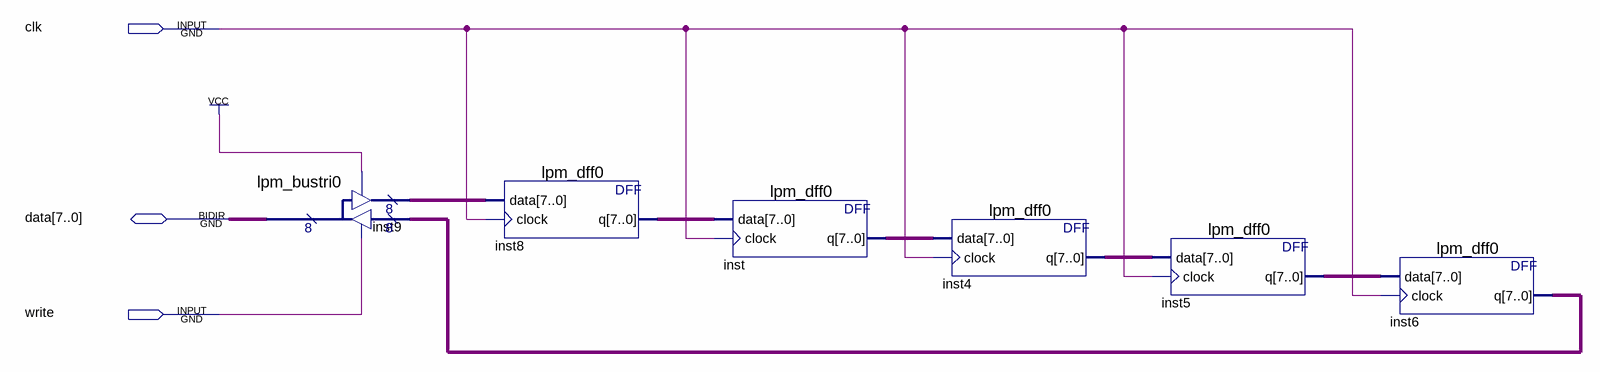
[diagram p0: schematic sheet]
// Quartus schematic Buffer.bdf as structural Verilog: 6 symbols, 3 pins
module Buffer (
  input  clk,
  input  write,
  inout  [7:0] data
);

  wire [7:0] inst4_q, inst5_q, inst6_q, inst8_q, inst9_result, inst_q;

  lpm_bustri0 inst9 (.enabledt(write), .data(inst6_q), .enabletr(1'b1), .result(inst9_result), .tridata(data));
  lpm_dff0 inst8 (.data(inst9_result), .clock(clk), .q(inst8_q));
  lpm_dff0 inst (.data(inst8_q), .clock(clk), .q(inst_q));
  lpm_dff0 inst4 (.data(inst_q), .clock(clk), .q(inst4_q));
  lpm_dff0 inst5 (.data(inst4_q), .clock(clk), .q(inst5_q));
  lpm_dff0 inst6 (.data(inst5_q), .clock(clk), .q(inst6_q));
endmodule
